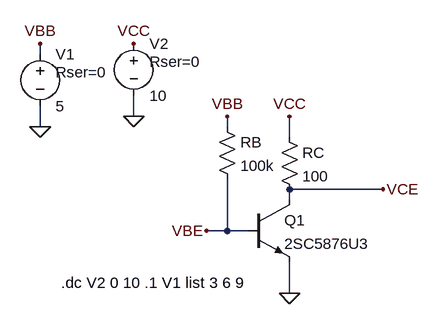
[diagram p0: schematic Partie1.asc]
Partie1.asc, the LTspice schematic file:
Version 4.1
SHEET 1 880 680
WIRE 128 -160 128 -176
WIRE 272 -64 272 -96
WIRE 128 -48 128 -80
WIRE 416 -48 416 -64
WIRE 512 -32 512 -64
WIRE 656 48 512 48
WIRE 512 64 512 48
WIRE 416 112 416 32
WIRE 416 112 384 112
WIRE 448 112 416 112
WIRE 512 208 512 160
FLAG 128 -48 0
FLAG 128 -176 VBB
FLAG 272 -64 0
FLAG 272 -176 VCC
FLAG 512 208 0
FLAG 416 -64 VBB
FLAG 512 -64 VCC
FLAG 656 48 VCE
FLAG 384 112 VBE
SYMBOL npn 448 64 R0
SYMATTR InstName Q1
SYMATTR Value 2SC5876U3
SYMBOL voltage 128 -176 R0
WINDOW 123 0 0 Left 0
WINDOW 39 24 44 Left 2
SYMATTR SpiceLine Rser=0
SYMATTR InstName V1
SYMATTR Value 5
SYMBOL voltage 272 -192 R0
WINDOW 123 0 0 Left 0
WINDOW 39 24 44 Left 2
SYMATTR SpiceLine Rser=0
SYMATTR InstName V2
SYMATTR Value 10
SYMBOL res 400 -64 R0
SYMATTR InstName RB
SYMATTR Value 100k
SYMBOL res 496 -48 R0
SYMATTR InstName RC
SYMATTR Value 100
TEXT 160 192 Left 2 !.dc V2 0 10 .1 V1 list 3 6 9

The netlist it stands for:
* Partie1.asc
Q1 VCE VBE 0 0 2SC5876U3
V1 VBB 0 5 Rser=0
V2 VCC 0 10 Rser=0
RB VBB VBE 100k
RC VCC VCE 100
.model NPN NPN
.model PNP PNP
.lib standard.bjt
.dc V2 0 10 .1 V1 list 3 6 9
.backanno
.end